# Altium schematic sheet Schematic.SchDoc
size A4; Author: Emmanuela Andam; DrawnBy: Emmanuela Andam; Engineer: Emmanuela Andam; SheetNumber: 1; SheetTotal: 1
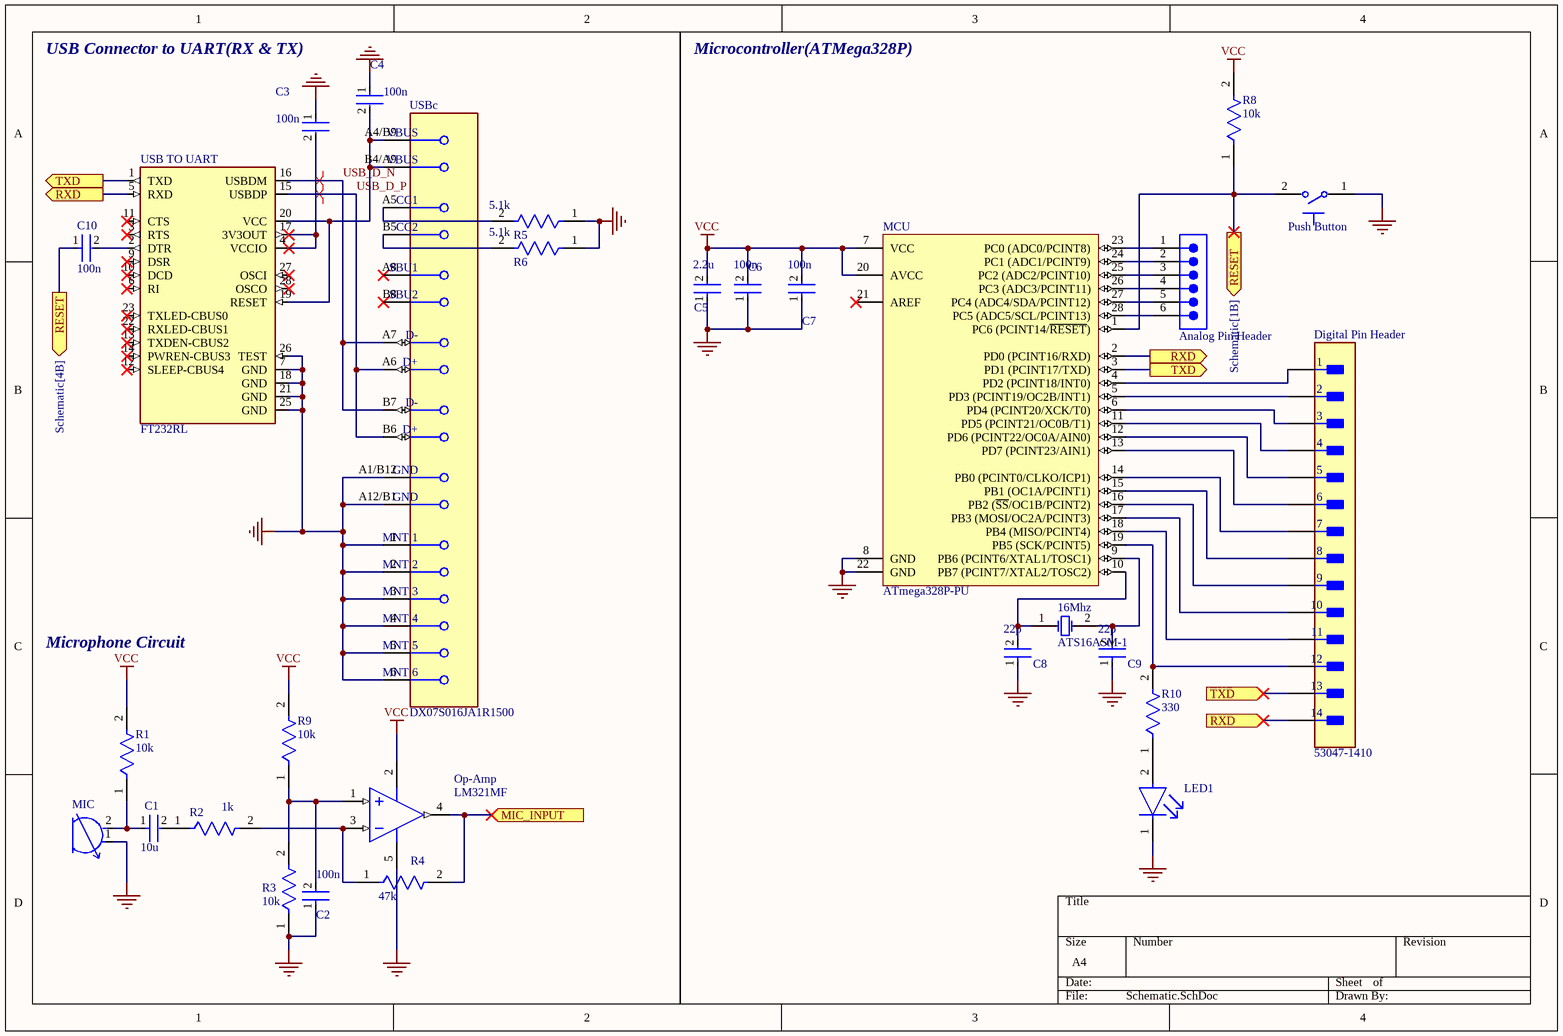
[diagram p0: Schematic.SchDoc]

## Parts
16Mhz  ATS16ASM-1  [CTS-ATS-SM-XTAL-2]
Analog_Pin_Header  TSW-106-07-T-S  [SMTC-TSW-106-07-X-S]  (value not drawn)
C1  10u  [FP-CC0603-DA-MFG]
C2  100n  [FP-CC0603-DA-MFG]
C3  100n  [FP-CC0603-DA-MFG]
C4  100n  [FP-CC0603-DA-MFG]
C5  2.2u  [FP-CC0603-DA-MFG]
C6  100n  [FP-CC0603-DA-MFG]
C7  100n  [FP-CC0603-DA-MFG]
C8  22p  [FP-CC0603-DA-MFG]
C9  22p  [FP-CC0603-DA-MFG]
C10  100n  [FP-CC0603-DA-MFG]
Digital_Pin_Header  53047-1410  [FP-53047-1410-MFG]
LED1  SML-P11VTT86R  [FP-SML-P1-MFG]  (value not drawn)
MCU  ATmega328P-PU  [28P3]
MIC  POM-3535P-3-R  [FP-POM-3535P-3-R-MFG]  (value not drawn)
Op-Amp  LM321MF  [DBV0005A_L]
Push_Button  TL1015AF160QG  [FP-TL1015AF160QG-MFG]  (value not drawn)
R1  10k  [FP-AC2512-MFG]
R2  1k  [FP-AC2512-MFG]
R3  10k  [FP-AC2512-MFG]
R4  47k  [FP-AC2512-MFG]
R5  5.1k  [FP-AC2512-MFG]
R6  5.1k  [FP-AC2512-MFG]
R8  10k  [FP-AC2512-MFG]
R9  10k  [FP-AC2512-MFG]
R10  330  [FP-AC2512-MFG]
USB_TO_UART  FT232RL  [SSOP28DB]
USBc  DX07S016JA1R1500  [FP-DX07S016JA1R1500-MFG]

## Ports
MIC_INPUT (in), RESET (out, see Schematic[1B]), RESET (out, see Schematic[4B]), RXD (in, see Schematic[1A], Schematic[3B]), RXD (out, see Schematic[1A], Schematic[4C]), RXD (out, see Schematic[3B], Schematic[4C]), TXD (in, see Schematic[1A], Schematic[3B]), TXD (out, see Schematic[1A], Schematic[4C]), TXD (out, see Schematic[3B], Schematic[4C])

## Nets
Ground: C2.1 C3.1 C4.1 C5.1 C6.1 C7.1 C8.1 C9.1 LED1.1(C) MCU.8(GND) MCU.22(GND) MIC.1(A) Op-Amp.5(V+) Push_Button.1 R3.1 R5.1 R6.1 USB_TO_UART.7(GND) USB_TO_UART.18(GND) USB_TO_UART.21(GND) USB_TO_UART.25(GND) USB_TO_UART.26(TEST) USBc.1(MNT_1) USBc.2(MNT_2) USBc.3(MNT_3) USBc.4(MNT_4) USBc.5(MNT_5) USBc.6(MNT_6) USBc.A1/B12(GND) USBc.A12/B1(GND)
VCC: C5.2 C6.2 C7.2 MCU.7(VCC) MCU.20(AVCC) Op-Amp.2(V-) R1.2 R8.2 R9.2
MIC_INPUT: Op-Amp.4(OUT) R4.2 ; port MIC_INPUT
RESET: C10.1 MCU.1(PC6_(PCINT14/~{RESET})) Push_Button.2 R8.1 ; port RESET
RXD: Digital_Pin_Header.14 MCU.2(PD0_(PCINT16/RXD)) USB_TO_UART.5(RXD) ; port RXD
TXD: Digital_Pin_Header.13 MCU.3(PD1_(PCINT17/TXD)) USB_TO_UART.1(TXD) ; port TXD
USB_D_N: USB_TO_UART.16(USBDM) USBc.A7(D-) USBc.B7(D-)
USB_D_P: USB_TO_UART.15(USBDP) USBc.A6(D+) USBc.B6(D+)
Net16Mhz_1: 16Mhz.1(X1) C8.2 MCU.10(PB7_(PCINT7/XTAL2/TOSC2))
Net16Mhz_2: 16Mhz.2(X2) C9.2 MCU.9(PB6_(PCINT6/XTAL1/TOSC1))
NetAnalog_Pin_Header_1: Analog_Pin_Header.1 MCU.23(PC0_(ADC0/PCINT8))
NetAnalog_Pin_Header_2: Analog_Pin_Header.2 MCU.24(PC1_(ADC1/PCINT9))
NetAnalog_Pin_Header_3: Analog_Pin_Header.3 MCU.25(PC2_(ADC2/PCINT10))
NetAnalog_Pin_Header_4: Analog_Pin_Header.4 MCU.26(PC3_(ADC3/PCINT11))
NetAnalog_Pin_Header_5: Analog_Pin_Header.5 MCU.27(PC4_(ADC4/SDA/PCINT12))
NetAnalog_Pin_Header_6: Analog_Pin_Header.6 MCU.28(PC5_(ADC5/SCL/PCINT13))
NetC1_1: C1.1 MIC.2(C) R1.1
NetC1_2: C1.2 R2.1
NetC2_2: C2.2 Op-Amp.1(IN+) R3.2 R9.1
NetC3_2: C3.2 USB_TO_UART.4(VCCIO) USB_TO_UART.17(3V3OUT)
NetC4_2: C4.2 USB_TO_UART.19(RESET) USB_TO_UART.20(VCC) USBc.A4/B9(VBUS) USBc.B4/A9(VBUS)
NetC10_2: C10.2 USB_TO_UART.2(DTR)
NetDigital_Pin_Header_1: Digital_Pin_Header.1 MCU.4(PD2_(PCINT18/INT0))
NetDigital_Pin_Header_2: Digital_Pin_Header.2 MCU.5(PD3_(PCINT19/OC2B/INT1))
NetDigital_Pin_Header_3: Digital_Pin_Header.3 MCU.6(PD4_(PCINT20/XCK/T0))
NetDigital_Pin_Header_4: Digital_Pin_Header.4 MCU.11(PD5_(PCINT21/OC0B/T1))
NetDigital_Pin_Header_5: Digital_Pin_Header.5 MCU.12(PD6_(PCINT22/OC0A/AIN0))
NetDigital_Pin_Header_6: Digital_Pin_Header.6 MCU.13(PD7_(PCINT23/AIN1))
NetDigital_Pin_Header_7: Digital_Pin_Header.7 MCU.14(PB0_(PCINT0/CLKO/ICP1))
NetDigital_Pin_Header_8: Digital_Pin_Header.8 MCU.15(PB1_(OC1A/PCINT1))
NetDigital_Pin_Header_9: Digital_Pin_Header.9 MCU.16(PB2_(~{SS}/OC1B/PCINT2))
NetDigital_Pin_Header_10: Digital_Pin_Header.10 MCU.17(PB3_(MOSI/OC2A/PCINT3))
NetDigital_Pin_Header_11: Digital_Pin_Header.11 MCU.18(PB4_(MISO/PCINT4))
NetDigital_Pin_Header_12: Digital_Pin_Header.12 MCU.19(PB5_(SCK/PCINT5)) R10.2
NetLED1_2: LED1.2(A) R10.1
NetOp-Amp_3: Op-Amp.3(IN-) R2.2 R4.1
NetR5_2: R5.2 USBc.A5(CC1)
NetR6_2: R6.2 USBc.B5(CC2)

Not connected (* = marked no-connect by the designer): MCU 21(AREF)*; USB_TO_UART 3(RTS)* 6(RI)* 9(DSR)* 10(DCD)* 11(CTS)* 12(SLEEP-CBUS4)* 13(TXDEN-CBUS2)* 14(PWREN-CBUS3)* 22(RXLED-CBUS1)* 23(TXLED-CBUS0)* 27(OSCI)* 28(OSCO)*; USBc A8(SBU1)* B8(SBU2)*

## Layout directives
differential pair: USB_D_N, USB_D_P

## Notes on the sheet
- USB Connector to UART(RX & TX)
- Microcontroller(ATMega328P)
- Microphone Circuit

## Library data of the parts
16Mhz = CMP-0585-00002-2: ATS-SM Series Quartz Crystal, 16 MHz, -20 to 70 degC, 11.1 x 4.83 x 4.3mm SMD, RoHS, Tape and Reel; Manufacturer: CTS Corporation; Shunt Capacitance (C0): 7.0 pF Max; Frequency: 16 MHz; Oscillation Mode: Fundamental or 3rd Overtone; Crystal Cut: AT-Cut; ESR Maximum: 40 Ohms; Drive Level (Type): 100 uW; PackageDescription: 2-Pin SMD, Body 11.1 x 4.83 mm, Pitch 8.5 mm; PackageReference: ATS-SM-XTAL-2; ComponentLink1URL: http://www.ctscorp.com/; PartNumber: ATS16ASM-1; RoHS: TRUE; ComponentLink1Description: Manufacturer URL; Operating Temperature: -20 to 70 degC; DatasheetVersion: Rev. K; ComponentLink2Description: Datasheet; Packing: Tape and Reel; ComponentLink2URL: http://www.ctscorp.com/components/Datasheets/008-0309-0.pdf; Mounting Technology: Surface Mount; ComponentLink3URL: http://www.ctscorp.com/components/Datasheets/008-0309-0.pdf; ComponentLink3Description: Package Specification
Analog_Pin_Header = CMP-1024-00384-1: 0.025" SQ Post Header, Through-hole, Vertical, -55 to 105 degC, 2.54 mm Pitch, 6-Pin, Male, RoHS; Manufacturer: Samtec; Pitch: 2.54 mm; ComponentLink3URL: http://www.samtec.com/documents/webfiles/cpdf/TSW-XXX-XX-XXX-X-XX-XXX-MKT.pdf; ComponentLink1Description: Manufacturer URL; Orientation: Vertical; ComponentLink2Description: Datasheet; ComponentLink1URL: http://www.samtec.com; RoHS: True; DatasheetVersion: F-214; PackageDescription: .025[0.64] SQ. Post Terminal Strip Assembly; PartNumber: TSW-106-07-T-S; Mounting Technology: Through-hole; PackageReference: TSW-106-07-X-S; PackageVersion: DM, 8/1988; ComponentLink3Description: Package Specification; ComponentLink2URL: http://www.samtec.com/documents/webfiles/pdf/TSW_TH.PDF; Temperature Range: -55 to 105 degC
C1-C10 = CMP-03422-000397-1: CC0603 22 nF X7R 20.00% 50 V; Manufacturer Part Number: CC0603MRX7R9BB223; Manufacturer: YAGEO; Value: 22 nF; Material: Ceramic; Tolerance: 0.2; Temperature Coefficient: 15%; Voltage: 50 V; Lead Free: Yes; Height: 0.9mm; Device Class L1: Passive Components; RoHS: TRUE; Footprint Url: http://www.yageo.com/exep/pages/download/literatures/UPY-C_GEN_24.pdf; ComponentLink2URL: http://www.yageo.com/documents/recent/UPY-GPHC_X7R_6.3V-to-50V_18.pdf; Automotive: No; Device Class L2: Capacitors; Temperature: -55°C to +125°C; Capacitance: 22 nF; Mouser Description: Surface Mount Ceramic Multilayer Capacitor 0.022uF 20% X7R 50V 0603 Paper T/R; Temperature Range High: +125°C; Temperature Range Low: -55°C; Octopart: https://octopart.com/cc0603mrx7r9bb223-yageo-88025763; Temperature Characteristic: X7R; Package: CC0603-DA; ComponentLink2Description: Datasheet; Category: Cap; Voltage Rating: 50 V; Device Class L3: Ceramic Capacitors
Digital_Pin_Header = CMP-04776-000893-1: CONN HEADER VERT 14POS 1.25MM; Manufacturer Series: 53047; IEC Conformance: No; Connector Type: Blade Pin; Number of Poles: 14; Number of Rows Loaded: 1; Contact Resistance: 20mR; Current Rating: 1A; Voltage Rating: 125V; Gender: Male; Insulation Resistance: 100MR; Body Plating: Tin; Option: General Purpose; Glow Wire Compliant: Non-compliant; Packaging: Tray; Contact Material: Bronze; Contact Finish - Mating: TIN; RoHS Compliant: Yes; Filter Feature: No; Lead Pitch: 1.25mm; Orientation: Vertical; Contact Plating: Tin; Number of Positions: 14; Housing Color: Natural; Termination: Solder; DIN Conformance: No; Number of Circuits: 14; Contact Type: Blade Pin; Package Quantity: 100; Mount: Through Hole; Contact Mating Length: 0.089inch; Number of Contacts: 14; Series: PicoBlade; Contact Gender: Male; Color: Natural; Voltage Rating (DC): 125V; Working Voltage: 125V; Radiation Hardening: No; Min Operating Temperature: -40°C; Mixed Contacts: No; Contact Finish - Termination: TIN; Number of Rows: 1; Pitch: 1.25mm; Flammability Rating: UL94 V-0; Mounting Style: STRAIGHT; Lead Free: Lead Free; Voltage Rating (AC): 125V; MIL Conformance: No; Max Operating Temperature: 85°C
LED1 = CMP-08952-000003-1: LED RED CLEAR 1006 SMD; Manufacturer: Rohm; Led Orientation: Top View; Power Dissipation: 50mW; Wavelength: 626nm; Forward Voltage: 1.8V; Forward Current: 1mA; Luminous Intensity: 4mcd; Reverse Voltage: 5V; ComponentLink2URL: https://www.rohm.com/datasheet/SML-P11VT(R)/sml-p11-e; Temperature: -40°C to +85°C; Device Class L2: LEDs; Package: SML-P1; Category: Diode; Automotive: No; RoHS: TRUE; Lead Free: Yes; Digikey Description: LED RED CLEAR 1006 SMD; Manufacturer Part Number: SML-P11VTT86R; Device Class L3: unset; ComponentLink2Description: Datasheet; Octopart: https://octopart.com/sml-p11vtt86r-rohm-34112314; Device Class L1: Optoelectronics; Temperature Range High: +85°C; Temperature Range Low: -40°C; Mouser Description: SML-P11 Series Red 0402 Clear 4 mcd 1.8 V Surface Mount PICOLED? LED; Height: 0.25mm; Colour: Red
MCU = CMP-0095-00013-2: 8-bit AVR Microcontroller, 32KB Flash, 1KB EEPROM, 2KB SRAM, 28-pin PDIP, Industrial Grade (-40°C to 85°C); RevisionNote: DatasheetVersion updated. URLs added.; PackageVersion: revB, Sep-2001; PackageDescription: 28-lead (0.300"/7.62mm Wide) Plastic Dual Inline Package (PDIP); DatasheetVersion: revD, May-2011; ComponentLink1Description: Manufacturer URL; ComponentLink1URL: http://www.atmel.com/; PackageReference: 28P3; ComponentLink2Description: ATmega48A/48PA/88A/88PA/168A/168PA/328/328P Datasheet; ComponentLink3URL: http://www.atmel.com/dyn/resources/prod_documents/8271S.pdf; ComponentLink2URL: http://www.atmel.com/dyn/resources/prod_documents/8271.pdf; ComponentLink3Description: ATmega48A/48PA/88A/88PA/168A/168PA/328/328P Summary
MIC = CMP-231723-000001-1: MIC COND ANALOG OMNI -35DB 6MM D; Resistance: 2200R; Direction: Omnidirectional; Impedance: 2.2kR; Shape: Round; Voltage Rating: 2V; Operating Supply Current: 500uA; Packaging: Bulk; Height: 3.7mm; Termination: PC Pins; Depth: 3.7mm; Diameter: 6mm; Mount: Through Hole; Package Quantity: 100; Output Type: Analog
Op-Amp = CMP-0055-01325-3: Low Power Single Op Amp, 5-pin SOT-23; Manufacturer: Texas Instruments; PackageTopMarking: A63A*XTT; CompType: Amplifiers; PowerWise: N; ComponentLink1URL: http://www.ti.com/general/docs/lit/getliterature.tsp?genericPartNumber=LM321&fileType=pdf; PinCount: 5; RoHS: N; ComponentLink1Description: Datasheet URL; Package Reference: DBV0005A; PackageDescription: Molded SOT-23, .115 x .063 x .040 in Body, 5 Lead, .0375 in Pitch
Push_Button = CMP-17879-000003-1: SWITCH TACTILE SPST-NO 0.05A 12V; Actuator Type: Standard; Actuator Length: 0.5mm; Contact Current Rating: 50mA; Mechanical Life: 200000Cycles; Switch Function: Off-Mom; Switch Travel: 0.2mm; Illumination Type: Non-Illuminated; Operating Force: 160gf; Actuator Material: Nylon; Electrical Life: 50000Cycles; Throw Configuration: SPST; Contact Resistance: 100mR; Orientation: Straight; Max Voltage Rating (DC): 12V; Max Operating Temperature: 70°C; Package Quantity: 1; Contact Material: Silver; Packaging: Tape and Reel; Mount: Surface Mount; Color: Beige; Termination: Gull Wing; Case/Package: SMD/SMT; Voltage Rating (DC): 12V; Contact Plating: Silver; REACH SVHC: No SVHC; Min Operating Temperature: -20°C; Current Rating: 50mA; Lead Free: Lead Free
R1-R6 R8-R10 = CMP-03412-028006-1: RES SMD 432 OHM 1% 1W 2512; Manufacturer: Yageo; Manufacturer Part Number: AC2512FK-07432RL; Voltage Rating: 200V; Tolerance: 0.01; Automotive Grade: Grade 0; Resistance: 432Ω; Description: AC2512 432Ω 1W 1.00%; Value: 432Ω; Device Class L3: Chip SMD Resistors; RoHS: TRUE; Height: 0.65mm; Device Class L1: Passive Components; Device Class L2: Resistors; Ipc Land Pattern Name: RESC635310X55; ComponentLink2Description: Datasheet; Temperature Range Low: -55°C; Composition: Thick Film; Digikey Description: RES SMD 432 OHM 1% 1W 2512; Temperature: -55°C to +155°C; Series: AC; Footprint Url: http://www.yageo.com/exep/pages/download/literatures/PYu-R_Mount_10.pdf; Automotive: Yes; Category: Res; ComponentLink2URL: http://www.yageo.com/documents/recent/PYu-AC_51_RoHS_L_6.pdf; Temperature Range High: +155°C; Package: AC2512; Lead Free: Yes; Power Rating: 1W; Octopart: https://octopart.com/ac2512fk-07432rl-yageo-71370083
USB_TO_UART = FT232RL: IC, USB TO UART, SMD, 28SSOP; Bridge Type:USB to UART; Supply Voltage Min:1.8V; Supply Voltage Max:5.25V; Interface Case Style:SSOP; No. of Pins:28Pins; Operating Temperature Min:-40Â°C; Operating Temperature Max:85Â°C; Product Range:FT232; Automotive Qua; MF: FTDI Chip; MP: FT232RLREEL; SnapEDA_Link: https://www.snapeda.com/parts/FT232RLREEL/FTDI/view-part/?ref=snap; Package: SSOP-28 FTDI, Future; Value: *; Check_prices: https://www.snapeda.com/parts/FT232RLREEL/FTDI/view-part/?ref=eda
USBc = CMP-19038-000003-1: CONN RCP USB2.0 TYP C 24P SMD RA